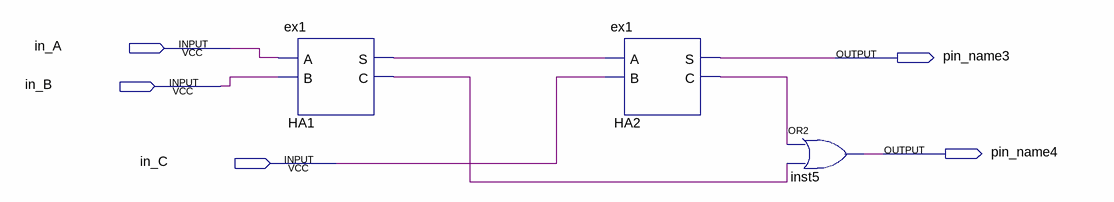
[diagram p0: schematic sheet]
// Quartus schematic ex1_with_blocks.bdf as structural Verilog: 3 symbols, 5 pins
module ex1_with_blocks (
  input  in_A,
  input  in_B,
  input  in_C,
  output pin_name3,
  output pin_name4
);

  wire HA1_c, HA1_s, HA2_c;

  ex1 HA1 (.A(in_A), .B(in_B), .S(HA1_s), .C(HA1_c));
  ex1 HA2 (.A(HA1_s), .B(in_C), .S(pin_name3), .C(HA2_c));
  or inst5 (pin_name4, HA2_c, HA1_c);
endmodule
